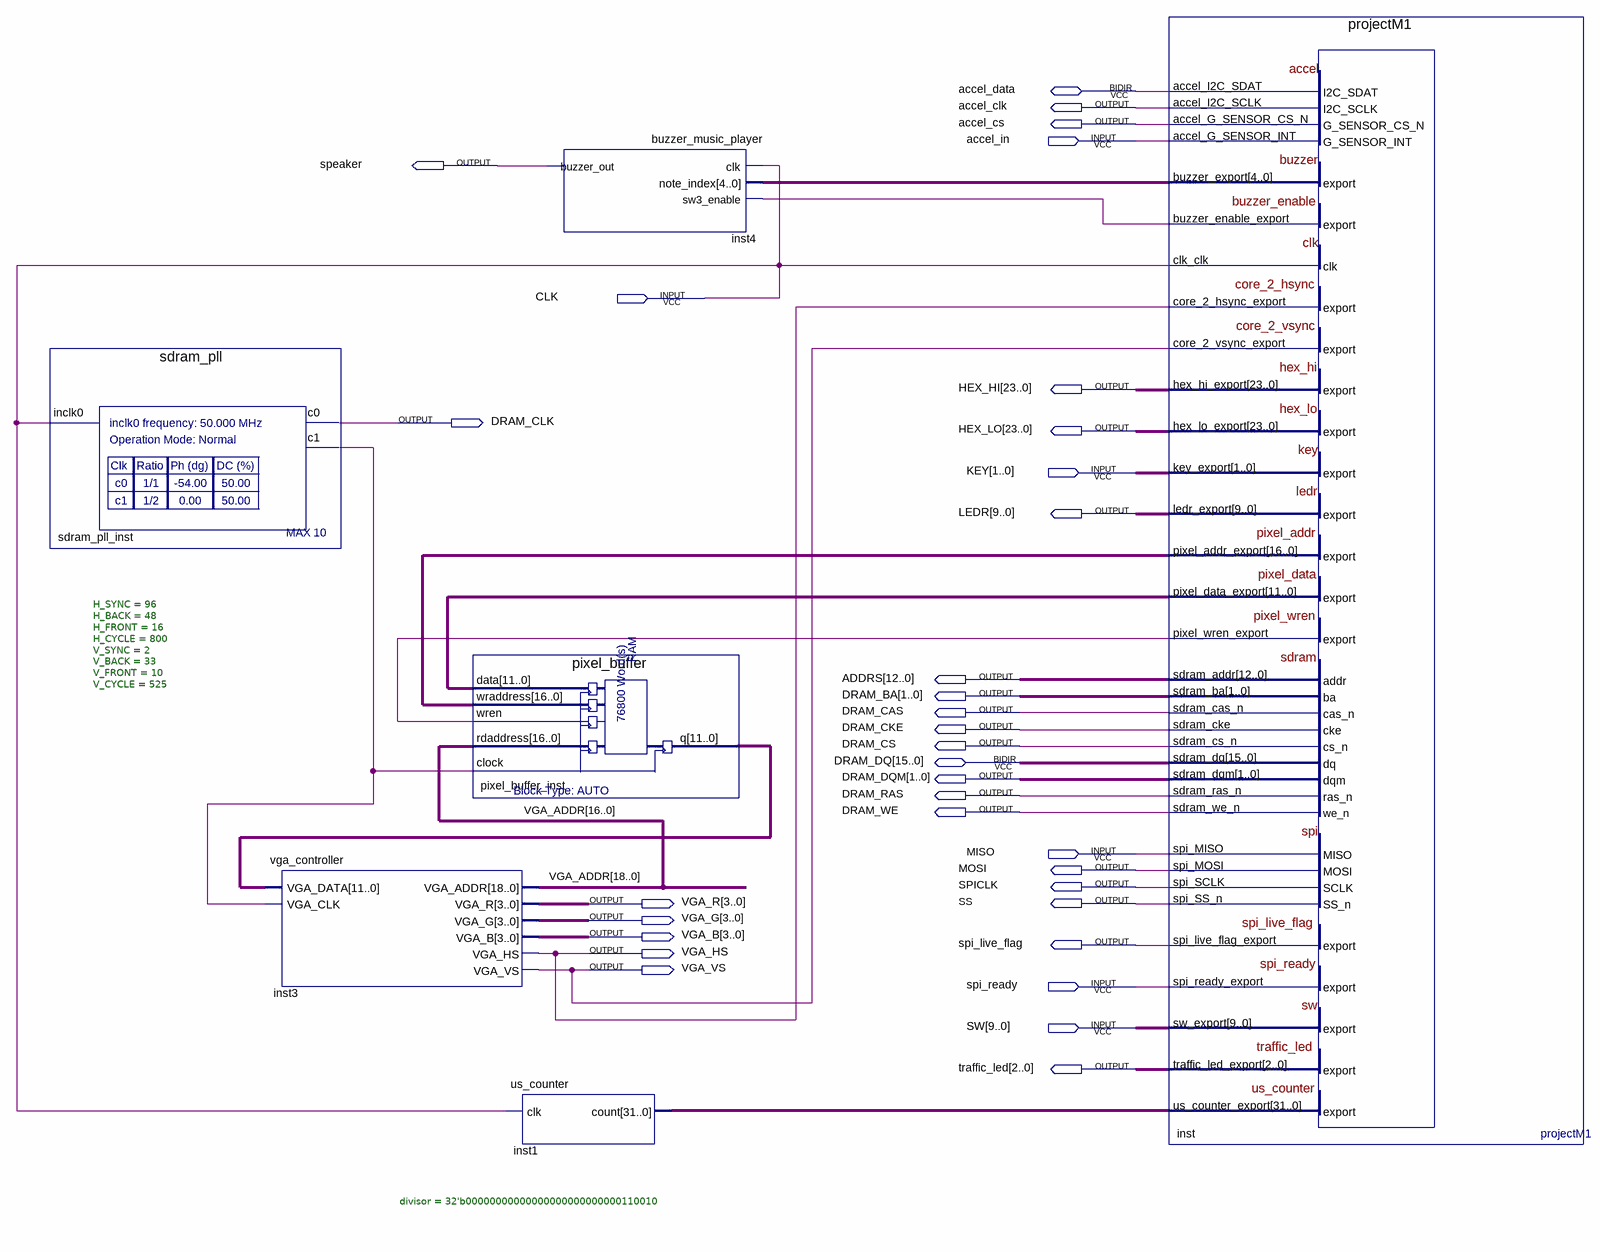
[diagram p0: schematic sheet]
// Quartus schematic top_levelM1.bdf as structural Verilog: 6 symbols, 33 pins
module top_levelM1 (
  input  accel_in,
  input  CLK,
  input  [1:0] KEY,
  input  MISO,
  input  spi_ready,
  input  [9:0] SW,
  inout  accel_data,
  inout  [15:0] DRAM_DQ,
  output accel_clk,
  output accel_cs,
  output speaker,
  output [23:0] HEX_HI,
  output DRAM_CLK,
  output [23:0] HEX_LO,
  output [9:0] LEDR,
  output [12:0] ADDRS,
  output [1:0] DRAM_BA,
  output DRAM_CAS,
  output DRAM_CKE,
  output DRAM_CS,
  output [1:0] DRAM_DQM,
  output DRAM_RAS,
  output DRAM_WE,
  output MOSI,
  output SPICLK,
  output [3:0] VGA_R,
  output SS,
  output [3:0] VGA_G,
  output [3:0] VGA_B,
  output spi_live_flag,
  output VGA_HS,
  output VGA_VS,
  output [2:0] traffic_led
);

  wire inst_buzzer_enable_export, inst_pixel_wren_export, sdram_pll_inst_c1;
  wire [4:0] inst_buzzer_export;
  wire [11:0] inst_pixel_data_export, pixel_buffer_inst_q;
  wire [16:0] inst_pixel_addr_export;
  wire [18:0] VGA_ADDR;
  wire [31:0] inst1_count;

  sdram_pll sdram_pll_inst (.inclk0(CLK), .c0(DRAM_CLK), .c1(sdram_pll_inst_c1));
  vga_controller #(.H_SYNC(96), .H_BACK(48), .H_FRONT(16), .H_CYCLE(800), .V_SYNC(2), .V_BACK(33), .V_FRONT(10), .V_CYCLE(525)) inst3 (
    .VGA_DATA(pixel_buffer_inst_q), .VGA_CLK(sdram_pll_inst_c1), .VGA_ADDR(VGA_ADDR), .VGA_R(VGA_R),
    .VGA_G(VGA_G), .VGA_B(VGA_B), .VGA_HS(VGA_HS), .VGA_VS(VGA_VS));
  pixel_buffer pixel_buffer_inst (
    .data(inst_pixel_data_export), .wraddress(inst_pixel_addr_export), .wren(inst_pixel_wren_export),
    .rdaddress(VGA_ADDR[16:0]), .clock(sdram_pll_inst_c1), .q(pixel_buffer_inst_q));
  us_counter #(.divisor(32'b00000000000000000000000000110010)) inst1 (.clk(CLK), .count(inst1_count));
  buzzer_music_player inst4 (
    .clk(CLK), .note_index(inst_buzzer_export), .sw3_enable(inst_buzzer_enable_export), .buzzer_out(speaker));
  projectM1 inst (
    .accel_G_SENSOR_INT(accel_in), .clk_clk(CLK), .core_2_hsync_export(VGA_HS), .core_2_vsync_export(VGA_VS),
    .key_export(KEY), .spi_MISO(MISO), .spi_ready_export(spi_ready), .sw_export(SW),
    .us_counter_export(inst1_count), .accel_I2C_SCLK(accel_clk), .accel_G_SENSOR_CS_N(accel_cs),
    .buzzer_export(inst_buzzer_export), .buzzer_enable_export(inst_buzzer_enable_export),
    .hex_hi_export(HEX_HI), .hex_lo_export(HEX_LO), .ledr_export(LEDR),
    .pixel_addr_export(inst_pixel_addr_export), .pixel_data_export(inst_pixel_data_export),
    .pixel_wren_export(inst_pixel_wren_export), .sdram_addr(ADDRS), .sdram_ba(DRAM_BA),
    .sdram_cas_n(DRAM_CAS), .sdram_cke(DRAM_CKE), .sdram_cs_n(DRAM_CS), .sdram_dqm(DRAM_DQM),
    .sdram_ras_n(DRAM_RAS), .sdram_we_n(DRAM_WE), .spi_MOSI(MOSI), .spi_SCLK(SPICLK), .spi_SS_n(SS),
    .spi_live_flag_export(spi_live_flag), .traffic_led_export(traffic_led), .accel_I2C_SDAT(accel_data),
    .sdram_dq(DRAM_DQ));
endmodule
